# Altium project TSMCN16-Test-PCB-V1.PrjPcb (part 2 of 2)
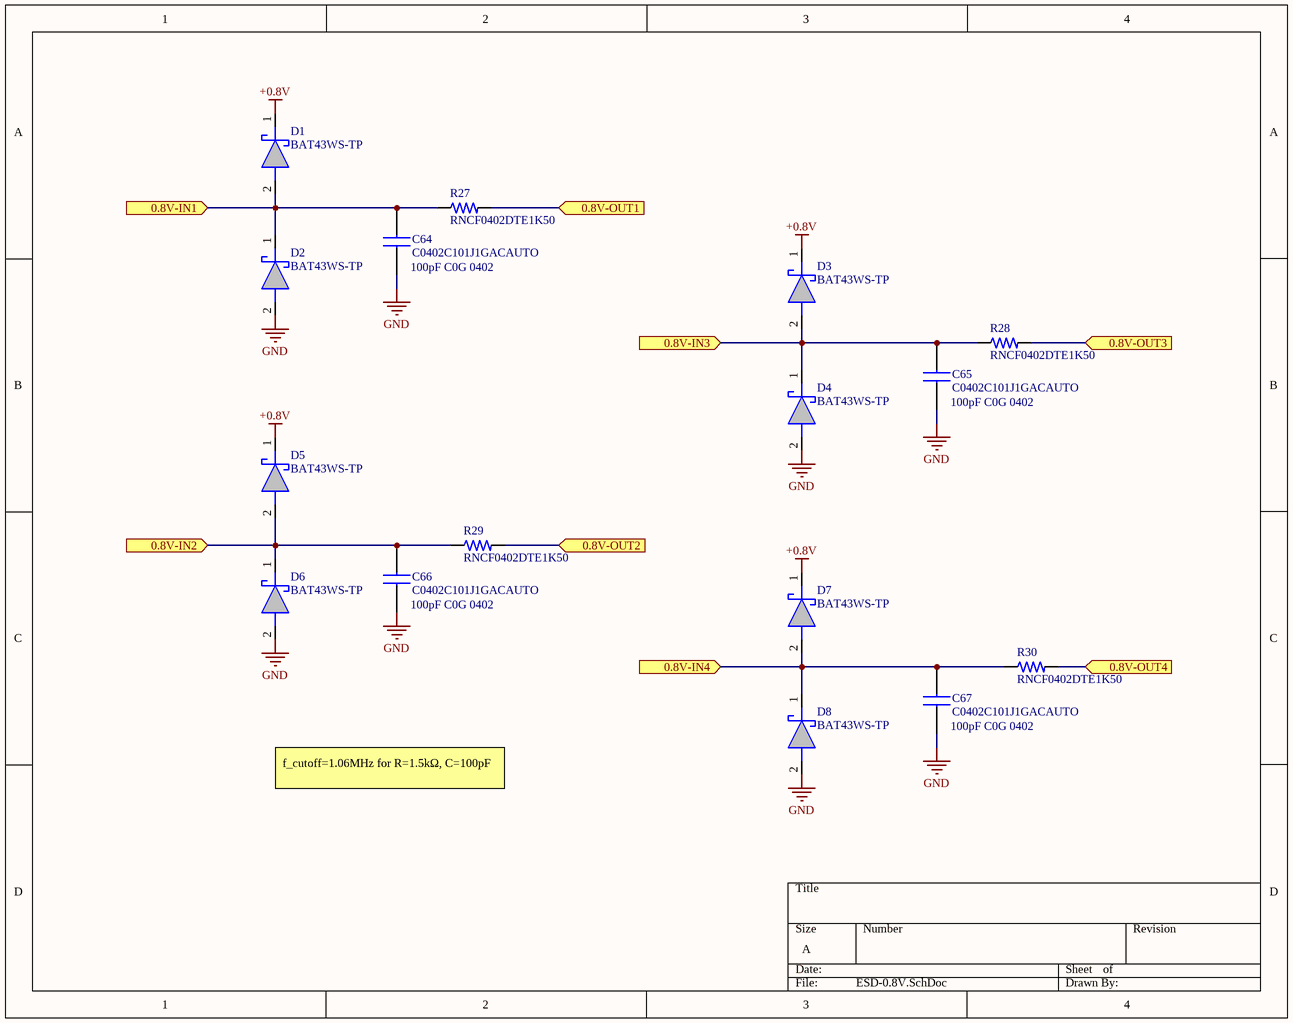
[diagram p11: ESD-0.8V.SchDoc]

## Nets that join several sheets
+0.3V: Connectors (C70.1 J14.1 R38.2), Chip (C45.2 C46.2 R12.1)
+0.05V: TIA (C2.2 C105.2 U1.3), Connectors (C33.1 J10.1 R36.2)
+0.8V: Connectors (C104.1 J13.1 R42.2), Chip (13 pins), U_Chip/U_ESD-0.8V (D_U41.1 D_U43.1 D_U45.1 D_U47.1), U_Chip/U_ESD-0.8V (D_U31.1 D_U33.1 D_U35.1 D_U37.1), U_Chip/U_ESD-0.8V (D_U21.1 D_U23.1 D_U25.1 D_U27.1), U_Chip/U_ESD-0.8V (D_U11.1 D_U13.1 D_U15.1 D_U17.1)
-0.2V: Connectors (C57.1 J12.1 R37.2), Chip (C41.2 C42.2 R11.1)
CHIPS_VSS: TIA (6 pins), Connectors (53 pins), ADC (14 pins), U_Power/U_LDO (8 pins), U_Power/U_LDO (8 pins), U_Power/U_LDO (8 pins), U_Power/U_LDO (8 pins), U_Power/U_LDO (8 pins), U_Power/U_LDO (8 pins), Chip (71 pins), U_Chip/U_ESD-0.8V (8 pins), U_Chip/U_ESD-0.8V (8 pins), U_Chip/U_ESD-0.8V (8 pins), U_Chip/U_ESD-0.8V (8 pins)
VDD_5V: TIA (C3.2 C4.2 C5.2 U1.5), Connectors (C75.1 D10.1 Q1.2 R40.2), ADC (8 pins), U_Power/U_LDO (7 pins), U_Power/U_LDO (7 pins), U_Power/U_LDO (7 pins), U_Power/U_LDO (7 pins), U_Power/U_LDO (7 pins), U_Power/U_LDO (7 pins)
+1.5V: U_Power/U_LDO (J_U526.2), Chip (C62.2 C63.2 R18.1)
+1.8V: U_Power/U_LDO (J_U326.2), Chip (C36.2 C58.2 R17.1)
+2.6V: U_Power/U_LDO (J_U226.2), Chip (C37.2 C38.2 R10.1)
+3.3V: ADC (B2.1 C9.2 C10.2 C80.2), U_Power/U_LDO (J_U626.2), Chip (12 pins)
+VDD_ERS: U_Power/U_LDO (J_U426.2), Chip (C67.2 C72.2 R20.1)
+VDD_HS: U_Power/U_LDO (J_U126.2), Chip (C59.2 C71.2 R16.1)
ADC_IN: Connectors (J28.2 J29.1), ADC (B1.7)
ANALOG_OUT: Connectors (J16.2 J16.4), Chip (C48.2 C49.2 R13.1)
BL0: Chip (U2.19), U_Chip/U_ESD-0.8V (C_U465.2 D_U43.2 D_U44.1 R_U428.1)
BL0-SAFE: Chip (U4.11), U_Chip/U_ESD-0.8V (R_U428.2)
BL1: Chip (U2.18), U_Chip/U_ESD-0.8V (C_U467.2 D_U47.2 D_U48.1 R_U430.1)
BL1-SAFE: Chip (U4.13), U_Chip/U_ESD-0.8V (R_U430.2)
BL2: Chip (U2.17), U_Chip/U_ESD-0.8V (C_U264.2 D_U21.2 D_U22.1 R_U227.1)
BL2-SAFE: Chip (U4.15), U_Chip/U_ESD-0.8V (R_U227.2)
BL3: Chip (U2.16), U_Chip/U_ESD-0.8V (C_U266.2 D_U25.2 D_U26.1 R_U229.1)
BL3-SAFE: Chip (U4.16), U_Chip/U_ESD-0.8V (R_U229.2)
BL_MODE_1: Chip (U3.15), U_Chip/U_ESD-0.8V (C_U165.2 D_U13.2 D_U14.1 R_U128.1)
BL_MODE_1-SAFE: Chip (U4.29), U_Chip/U_ESD-0.8V (R_U128.2)
BL_MODE_2: Chip (U3.14), U_Chip/U_ESD-0.8V (C_U167.2 D_U17.2 D_U18.1 R_U130.1)
BL_MODE_2-SAFE: Chip (U4.32), U_Chip/U_ESD-0.8V (R_U130.2)
BLINPUT: Chip (U2.20), U_Chip/U_ESD-0.8V (C_U466.2 D_U45.2 D_U46.1 R_U429.1)
BLINPUT-SAFE: Chip (U4.9), U_Chip/U_ESD-0.8V (R_U429.2)
NetB2_2: Connectors (J1.1), ADC (B2.2)
NetB2_3: Connectors (J1.2), ADC (B2.3)
NetB2_4: Connectors (J1.3), ADC (B2.4)
NetB2_5: Connectors (J1.4), ADC (B2.5)
NetB2_8: Connectors (J1.5), ADC (B2.8)
NetC1_1: TIA (5 pins), Connectors (J16.1)
NetC20_2: Connectors (P1.2), Chip (C20.2 C54.2 R15.1)
NetC44_2: Connectors (P2.2), Chip (C44.2 C68.2 R19.1)
NetC50_2: Connectors (J3.2), Chip (C50.2 C53.2 R14.1)
NetJ6_2: Connectors (J6.2), Chip (U2.3)
NetJ6_4: Connectors (J6.4), Chip (U2.4)
NetJ6_6: Connectors (J6.6), Chip (U2.5)
NetJ6_8: Connectors (J6.8), Chip (U2.6)
NetJ7_2: Connectors (J7.2), Chip (U2.7)
NetJ7_4: Connectors (J7.4), Chip (U2.8)
NetJ7_6: Connectors (J7.6), Chip (U2.9)
NetJ7_8: Connectors (J7.8), Chip (U2.10)
NetJ8_1: Connectors (J8.1), Chip (U3.10)
NetJ8_3: Connectors (J8.3), Chip (U3.9)
NetJ8_5: Connectors (J8.5), Chip (U3.8)
NetJ8_7: Connectors (J8.7), Chip (U3.7)
NetJ9_1: Connectors (J9.1), Chip (U3.6)
NetJ9_3: Connectors (J9.3), Chip (U3.5)
NetJ9_5: Connectors (J9.5), Chip (U3.4)
NetJ9_7: Connectors (J9.7), Chip (U3.3)
NetJ29_2: TIA (R2.2), Connectors (J29.2)
NetJ30_1: Connectors (J30.1), Chip (R23.2 U2.22)
NetJ31_1: Connectors (J31.1), Chip (R24.2 U3.22)
VDD_DNW_B: Connectors (C16.1 J17.1 R34.2), Chip (C17.2 C18.2 R8.1)
WL0: Chip (U2.15), U_Chip/U_ESD-0.8V (C_U265.2 D_U23.2 D_U24.1 R_U228.1)
WL0-SAFE: Chip (U4.17), U_Chip/U_ESD-0.8V (R_U228.2)
WL1: Chip (U2.14), U_Chip/U_ESD-0.8V (C_U267.2 D_U27.2 D_U28.1 R_U230.1)
WL1-SAFE: Chip (U4.18), U_Chip/U_ESD-0.8V (R_U230.2)
WL2: Chip (U3.21), U_Chip/U_ESD-0.8V (C_U364.2 D_U31.2 D_U32.1 R_U327.1)
WL2-SAFE: Chip (U4.19), U_Chip/U_ESD-0.8V (R_U327.2)
WL3: Chip (U3.20), U_Chip/U_ESD-0.8V (C_U366.2 D_U35.2 D_U36.1 R_U329.1)
WL3-SAFE: Chip (U4.23), U_Chip/U_ESD-0.8V (R_U329.2)
WL4: Chip (U3.18), U_Chip/U_ESD-0.8V (C_U365.2 D_U33.2 D_U34.1 R_U328.1)
WL4-SAFE: Chip (U4.24), U_Chip/U_ESD-0.8V (R_U328.2)
WL5: Chip (U3.19), U_Chip/U_ESD-0.8V (C_U367.2 D_U37.2 D_U38.1 R_U330.1)
WL5-SAFE: Chip (U4.25), U_Chip/U_ESD-0.8V (R_U330.2)
WL_MODE_1: Chip (U3.17), U_Chip/U_ESD-0.8V (C_U164.2 D_U11.2 D_U12.1 R_U127.1)
WL_MODE_1-SAFE: Chip (U4.26), U_Chip/U_ESD-0.8V (R_U127.2)
WL_MODE_2: Chip (U3.16), U_Chip/U_ESD-0.8V (C_U166.2 D_U15.2 D_U16.1 R_U129.1)
WL_MODE_2-SAFE: Chip (U4.28), U_Chip/U_ESD-0.8V (R_U129.2)
WLINPUT: Chip (U2.21), U_Chip/U_ESD-0.8V (C_U464.2 D_U41.2 D_U42.1 R_U427.1)
WLINPUT-SAFE: Chip (U4.7), U_Chip/U_ESD-0.8V (R_U427.2)

## Assembly variants
TIA without Feedback Capacitor: not fitted C1
Without Silkscreen: all parts fitted